# Altium schematic sheet Main.SchDoc
size A4; SheetNumber: 1; SheetTotal: 6
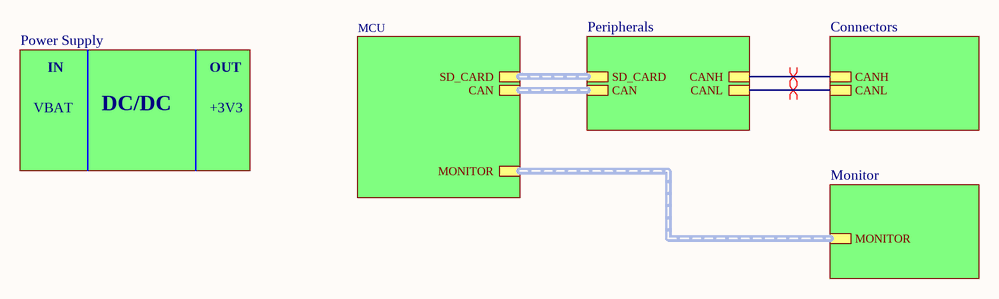
[diagram p0: Main.SchDoc]

## Sub-sheets
Connectors = Connectors.SchDoc: CANH, CANL
MCU = MCU.SchDoc: SD_CARD (harness SD), MONITOR (harness MONITOR), CAN (harness CAN)
Monitor = MonitorSchDoc.SchDoc: MONITOR (harness MONITOR)
Peripherals = Peripherals.SchDoc: SD_CARD (harness SD), CAN (harness CAN), CANH, CANL
Power Supply = PowerSupply.SchDoc: no entries

## Nets
(unnamed): sheet Peripherals/CANH, sheet Connectors/CANH
(unnamed): sheet Peripherals/CANL, sheet Connectors/CANL

## Buses and harness runs
harness sheet MCU/CAN = sheet Peripherals/CAN
harness sheet MCU/MONITOR = sheet Monitor/MONITOR
harness sheet MCU/SD_CARD = sheet Peripherals/SD_CARD

## Layout directives
differential pair: (no net found under the mark)

## Notes on the sheet
- IN
- VBAT
- DC/DC
- +3V3
- OUT
- Title:
- File name:
- Author:
- Reviewed by:
- Last Update:
- Project name:
- Sheet
- out of